# Altium project Audio_Visualizer.PrjPcb
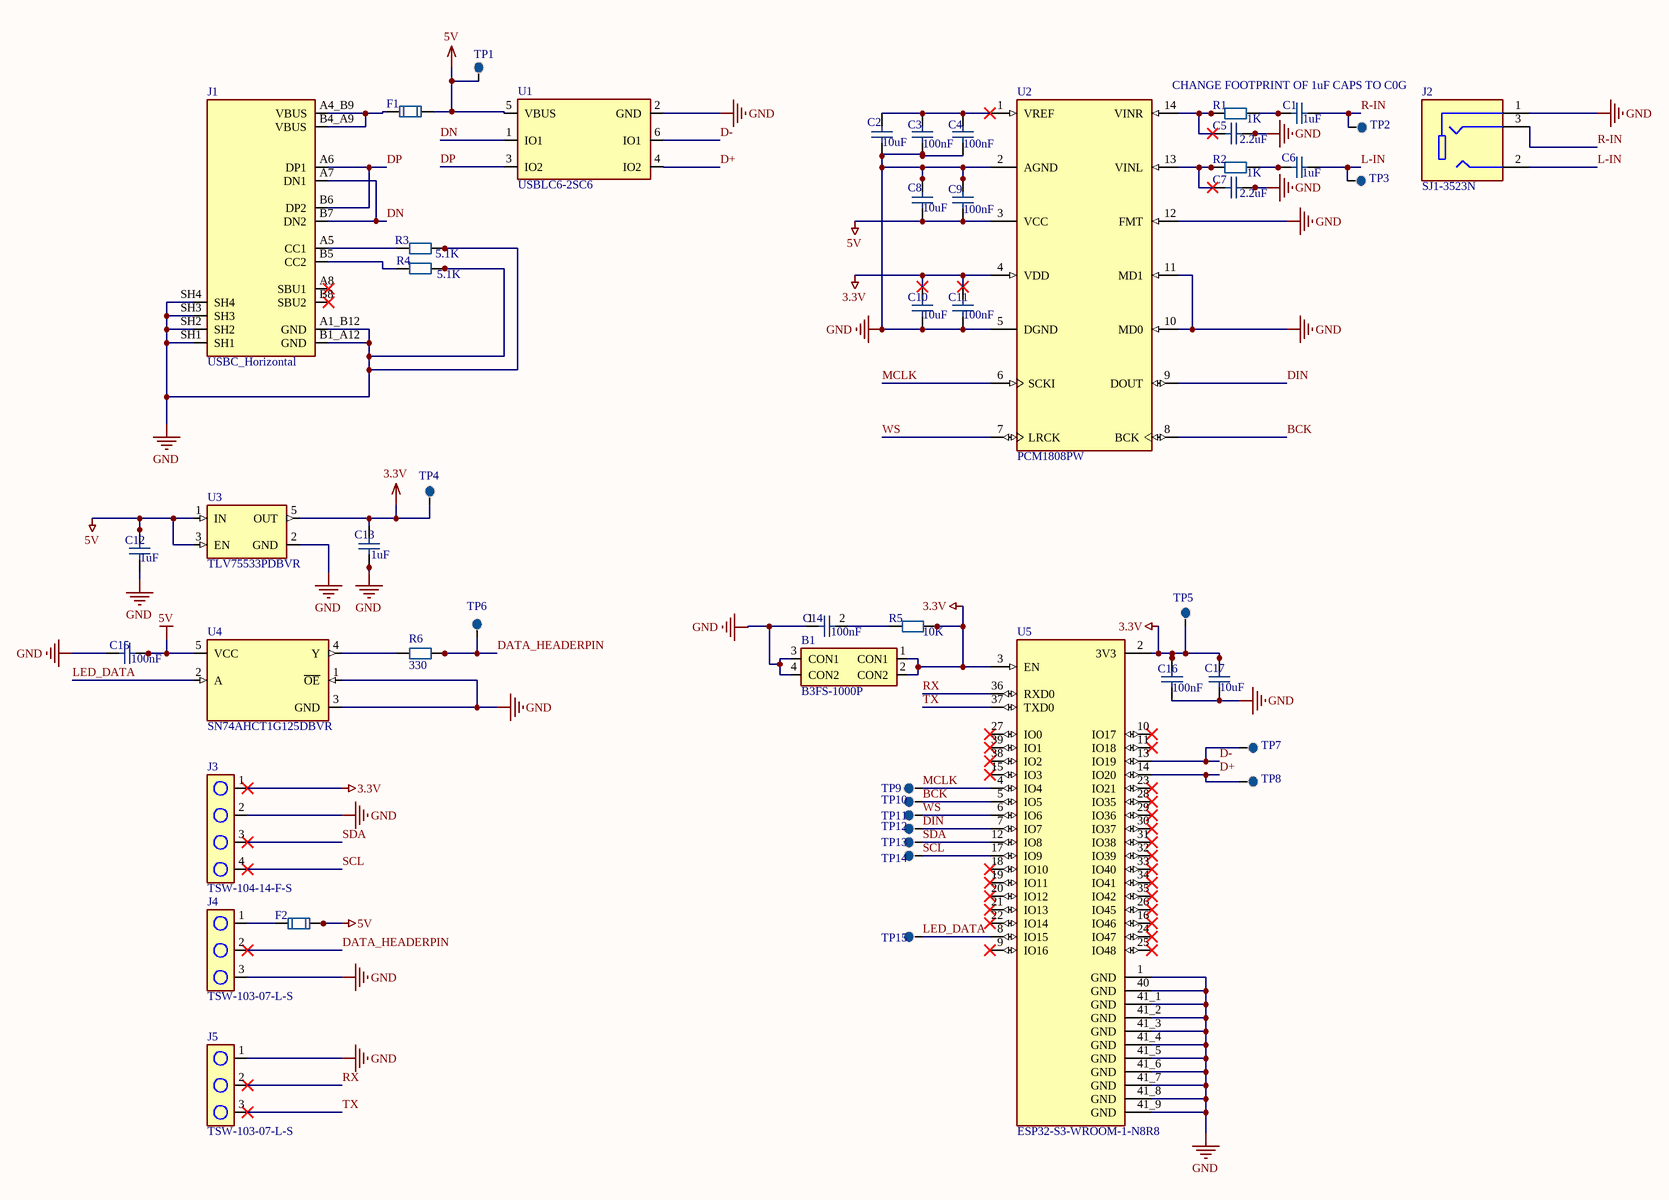
[diagram p0: Sheet1.SchDoc]
1 sheet, 51 parts. Net scope: global (net labels, ports and power ports of the same name join across sheets).
Board file: PCB1.PcbDoc

## Sheet Sheet1.SchDoc
size A2; SheetNumber: 1; SheetTotal: 1

### Parts
B1  B3FS-1000P  [BUTTON_NO_REAL]
C1  1uF  [CAP_0603]
C2  10uF  [CAP_0603]
C3  100nF  [CAP_0603]
C4  100nF  [CAP_0603]
C5  2.2uF  [CAP_0603]
C6  1uF  [CAP_0603]
C7  2.2uF  [CAP_0603]
C8  10uF  [CAP_0603]
C9  100nF  [CAP_0603]
C10  10uF  [CAP_0603]
C11  100nF  [CAP_0603]
C12  1uF  [CAP_0603]
C13  1uF  [CAP_0603]
C14  100nF  [CAP_0603]
C15  100nF  [CAP_0603]
C16  100nF  [CAP_0603]
C17  10uF  [CAP_0603]
F1  (no value)  [FUSE_1206]
F2  Fuse_1206  [FUSE_1206]  (value not drawn)
J1  USBC_Horizontal  [USBC_Horizontal]
J2  SJ1-3523N  [SJ1-3523N]
J3  TSW-104-14-F-S  [TSW-104-14-F-S]
J4  TSW-103-07-L-S  [TSW-103-07-L-S]
J5  TSW-103-07-L-S  [TSW-103-07-L-S]
R1  1K  [RES_0603]
R2  1K  [RES_0603]
R3  5.1K  [RES_0603]
R4  5.1K  [RES_0603]
R5  10K  [RES_0603]
R6  330  [RES_0603]
TP1  TestPoint_0.4mm  [TestPoint_0.4mm_SMD]  (value not drawn)
TP2  TestPoint_0.4mm  [TestPoint_0.4mm_SMD]  (value not drawn)
TP3  TestPoint_0.4mm  [TestPoint_0.4mm_SMD]  (value not drawn)
TP4  TestPoint_0.4mm  [TestPoint_0.4mm_SMD]  (value not drawn)
TP5  TestPoint_0.4mm  [TestPoint_0.4mm_SMD]  (value not drawn)
TP6  TestPoint_0.4mm  [TestPoint_0.4mm_SMD]  (value not drawn)
TP7  TestPoint_0.4mm  [TestPoint_0.4mm_SMD]  (value not drawn)
TP8  TestPoint_0.4mm  [TestPoint_0.4mm_SMD]  (value not drawn)
TP9  TestPoint_0.4mm  [TestPoint_0.4mm_SMD]  (value not drawn)
TP10  TestPoint_0.4mm  [TestPoint_0.4mm_SMD]  (value not drawn)
TP11  TestPoint_0.4mm  [TestPoint_0.4mm_SMD]  (value not drawn)
TP12  TestPoint_0.4mm  [TestPoint_0.4mm_SMD]  (value not drawn)
TP13  TestPoint_0.4mm  [TestPoint_0.4mm_SMD]  (value not drawn)
TP14  TestPoint_0.4mm  [TestPoint_0.4mm_SMD]  (value not drawn)
TP15  TestPoint_0.4mm  [TestPoint_0.4mm_SMD]  (value not drawn)
U1  USBLC6-2SC6  [USBLC6-2SC6]
U2  PCM1808PW  [PCM1808PW]
U3  TLV75533PDBVR  [TLV75533PDBVR]
U4  SN74AHCT1G125DBVR  [SN74AHCT1G125DBVR]
U5  ESP32-S3-WROOM-1-N8R8  [ESP32-S3-WROOM-1-N8R8]

### Nets
3.3V: B1.1(CON1) B1.2(CON2) C10.2 C11.2 C13.2 C16.2 C17.2 J3.1 R5.2 TP4.1 TP5.1 U2.4(VDD) U3.5(OUT) U5.2(3V3) U5.3(EN)
5V: C8.1 C9.1 C12.2 C15.2 F1.2 F2.2 TP1.1 U1.5(VBUS) U2.3(VCC) U3.1(IN) U3.3(EN) U4.5(VCC)
GND: B1.3(CON1) B1.4(CON2) C2.1 C3.1 C4.1 C5.1 C7.1 C8.2 C9.2 C10.1 C11.1 C12.1 C13.1 C14.1 C15.1 C16.1 C17.1 J1.A1_B12(GND) J1.B1_A12(GND) J1.SH1 J1.SH2 J1.SH3 J1.SH4 J2.1 J3.2 J4.3 J5.1 R3.2 R4.2 U1.2(GND) U2.2(AGND) U2.5(DGND) U2.10(MD0) U2.11(MD1) U2.12(FMT) U3.2(GND) U4.1(~{OE}) U4.3(GND) U5.1(GND) U5.40(GND) U5.41_1(GND) U5.41_2(GND) U5.41_3(GND) U5.41_4(GND) U5.41_5(GND) U5.41_6(GND) U5.41_7(GND) U5.41_8(GND) U5.41_9(GND)
BCK: TP10.1 U2.8(BCK) U5.5(IO5)
D+: TP8.1 U1.4(IO2) U5.14(IO20)
D-: TP7.1 U1.6(IO1) U5.13(IO19)
DATA_HEADERPIN: J4.2 R6.2 TP6.1
DIN: TP12.1 U2.9(DOUT) U5.7(IO7)
DN: J1.A7(DN1) J1.B7(DN2) U1.1(IO1)
DP: J1.A6(DP1) J1.B6(DP2) U1.3(IO2)
L-IN: C6.2 J2.2 TP3.1
LED_DATA: TP15.1 U4.2(A) U5.8(IO15)
MCLK: TP9.1 U2.6(SCKI) U5.4(IO4)
R-IN: C1.2 J2.3 TP2.1
RX: J5.2 U5.36(RXD0)
SCL: J3.4 TP14.1 U5.17(IO9)
SDA: J3.3 TP13.1 U5.12(IO8)
TX: J5.3 U5.37(TXD0)
WS: TP11.1 U2.7(LRCK) U5.6(IO6)
NetC1_1: C1.1 R1.2
NetC2_2: C2.2 C3.2 C4.2 U2.1(VREF)
NetC5_2: C5.2 R1.1 U2.14(VINR)
NetC6_1: C6.1 R2.2
NetC7_2: C7.2 R2.1 U2.13(VINL)
NetC14_2: C14.2 R5.1
NetF1_1: F1.1 J1.A4_B9(VBUS) J1.B4_A9(VBUS)
NetF2_1: F2.1 J4.1
NetJ1_A5: J1.A5(CC1) R3.1
NetJ1_B5: J1.B5(CC2) R4.1
NetR6_1: R6.1 U4.4(Y)

Not connected (* = marked no-connect by the designer): J1 A8(SBU1)* B8(SBU2)*; U5 9(IO16)* 10(IO17)* 11(IO18)* 15(IO3)* 16(IO46)* 18(IO10)* 19(IO11)* 20(IO12)* 21(IO13)* 22(IO14)* 23(IO21)* 24(IO47)* 25(IO48)* 26(IO45)* 27(IO0)* 28(IO35)* 29(IO36)* 30(IO37)* 31(IO38)* 32(IO39)* 33(IO40)* 34(IO41)* 35(IO42)* 38(IO2)* 39(IO1)*

### Notes on the sheet
- CHANGE FOOTPRINT OF 1uF CAPS TO C0G

### Library data of the parts
C1 C6 C12 C13 = C_1u_0603: 1 uF 10% 0603 X7R MLCC; Manufacturer: Yageo; Manufacturer Part Number: CC0603KRX7R7BB105; Package (Imperial): 0603; Voltage Rating DC: 16 VDC; Value: 1 uF; Tolerance: 10%; Dielectric: X7R; Datasheet: https://yageogroup.com/component-documentation/download/datasheet/CC0603KRX7R7BB105?lang=en
C2 C8 C10 C17 = C_10u_0805: 10 uF 10% 0805 X7R MLCC; Manufacturer: Yageo; Manufacturer Part Number: C0805C106K8RACTU; Parameter (Imperial): 0805; Voltage Rating DC: 10 VDC; Value: 10 uF; Tolerance: 10%; Dielectric: X7R; Datasheet: https://yageogroup.com/component-documentation/download/datasheet/C0805C106K8RACTU?lang=en
C3 C4 C9 C11 C14-C16 = C_100n_0603: 100 nF 1% 0603 X7R MLCC; Manufacturer: Yageo; Manufacturer Part Number: CC0603KRX7R9BB104; Package (Imperial): 0603; Voltage Rating DC: 50 VDC; Value: 100 nF; Tolerance: 1%; Dielectric: X7R; Datasheet: https://yageogroup.com/component-documentation/download/datasheet/CC0603KRX7R9BB104?lang=en
C5 C7 = C_2.2u_0603: 2.2 uF 10% 0603 X7R MLCC; Manufacturer: Yageo; Manufacturer Part Number: CC0603KRX7R7BB225; Package (Imperial): 0603; Voltage Rating DC: 16 VDC; Value: 2.2 uF; Tolerance: 10%; Dielectric: X7R; Datasheet: *
F1 F2 = Fuse_1206: Manufacturer: Littelfuse; Manufacturer Part Number: 0440007.WR; Package (Imperial): 1206; Fuse Type: Fast Blow; Current Rating: 7 A; Voltage Rating DC: 32 VDC; Voltage Rating AC: 32 VAC
J1 = USBC_Horizontal: USB-C, USB-2.0 SMD 16 contacts, horizontal; Manufacturer: GCT; Manufacturer Part Number: USB4105GFA; Number of Contacts: 16; Current Rating: 5 A; Voltage Rating: 48 VDC; Standard: USB-2.0; Termination: SMD
R1 R2 = R_1K_0603: 1 kOhm 1% 0603 resistor; Manufacturer: Yageo; Manufacturer Part Number: RC0603FR-071KL; Value: 1 kOhm; Package (Imperial): 0603; Power Rating: 0.1 W; Voltage Rating: 75 V; Tolerance: 1%; ComponentLink1Description: Datasheet; ComponentLink1URL: https://yageogroup.com/component-documentation/download/datasheet/RC0603FR-071KL?lang=en
R3 R4 = R_5.1K_0603: 5.1 kOhm 1% 0603 resistor; Manufacturer: Yageo; Manufacturer Part Number: RC0603FR-075K1L; Package (Imperial): 0603; Power Rating: 0.1 W; Voltage Rating: 75 V; Value: 5.1 kOhm; Tolerance: 1%; ComponentLink1Description: Datasheet; ComponentLink1URL: https://yageogroup.com/content/datasheet/asset/file/PYU-RC_GROUP_51_ROHS_L
R5 = R_10K_0603: 10 kOhm 1% 0603 resistor; Manufacturer: Yageo; Manufacturer Part Number: RC0603FR-0710KL; Value: 10 kOhm; Package (Imperial): 0603; Power Rating: 0.1 W; Voltage Rating: 75 V; Tolerance: 1%; ComponentLink1Description: Datasheet; ComponentLink1URL: https://yageogroup.com/component-documentation/download/datasheet/RC0603FR-0710KL?lang=en
R6 = R_330_0603: 330 Ohm 1% 0603 resistor; Manufacturer: Yageo; Manufacturer Part Number: RC0603FR-07330RL; Value: 330 Ohm; Package (Imperial): 0603; Power Rating: 0.1 W; Voltage Rating: 75 V; Tolerance: 1%; ComponentLink1Description: Datasheet; ComponentLink1URL: https://yageogroup.com/component-documentation/download/datasheet/RC0603FR-07330RL?lang=en
TP1-TP15 = TestPoint_0.4mm: SMD Testpoint. No component to be bought.
U1 = USBLC6-2SC6: Dual-line ESD Surge Protector, 0.6 pF; Manufacturer: STMicroelectronics; Manufacturer Part Number: USBLC6-2SC6; Package: SOT-23-6; Topology: -; Input Voltage: -; Output Voltage: -; Output Current: -
U3 = TLV75533PDBVR: LDO 500 mA - 5V to 3.3V; Manufacturer: Texas Instruments; Output Current: 500 mA; Manufacturer Part Number: TLV75533PDBVR; Package: SOT-23-5; Topology: *; Input Voltage: 5 V; Output Voltage: 3.3 V; ComponentLink1Description: Datasheet; ComponentLink1URL: https://www.ti.com/lit/gpn/tlv755p
U5 = ESP32-S3-WROOM-1-N8R8: Manufacturer: Espressif; Input Voltage: 3-3.6 V; Operating Voltage: 3.3 V; Manufacturer Part Number: ESP32-S3-WROOM-1-N8R8; Package: SMD Module; Topology: -; Output Voltage: -; Output Current: -; ComponentLink1Description: Datasheet; ComponentLink1URL: https://www.mouser.in/datasheet/3/1574/1/esp32-s3-wroom-1_wroom-1u_datasheet_en.pdf